# EAGLE schematic Schema passe-bas (EAGLE 9.4.2)
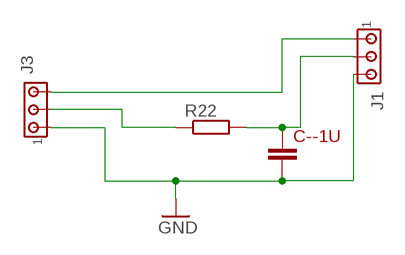
[diagram p0: schematic, sheet 1]

## Parts
C--1U  C-EU025_050-025X075  [C025_050-025X075]
J1  MTA03-100  [10X03MTA]
J3  MTA03-100  [10X03MTA]
R22  R-EU_0207/12  [0207/12]

## Nets
GND: C--1U.2 J1.3 J3.1
N$1: J1.1 J3.3
N$3: J3.2 R22.1
N$4: C--1U.1 J1.2 R22.2

## Library data of the parts
C--1U = rcl:C-EU: CAPACITOR, European symbol; SPICEPREFIX: C
J1 J3 = con-amp:MTA03-100: AMP connector
R22 = rcl:R-EU_: RESISTOR, European symbol; SPICEPREFIX: R